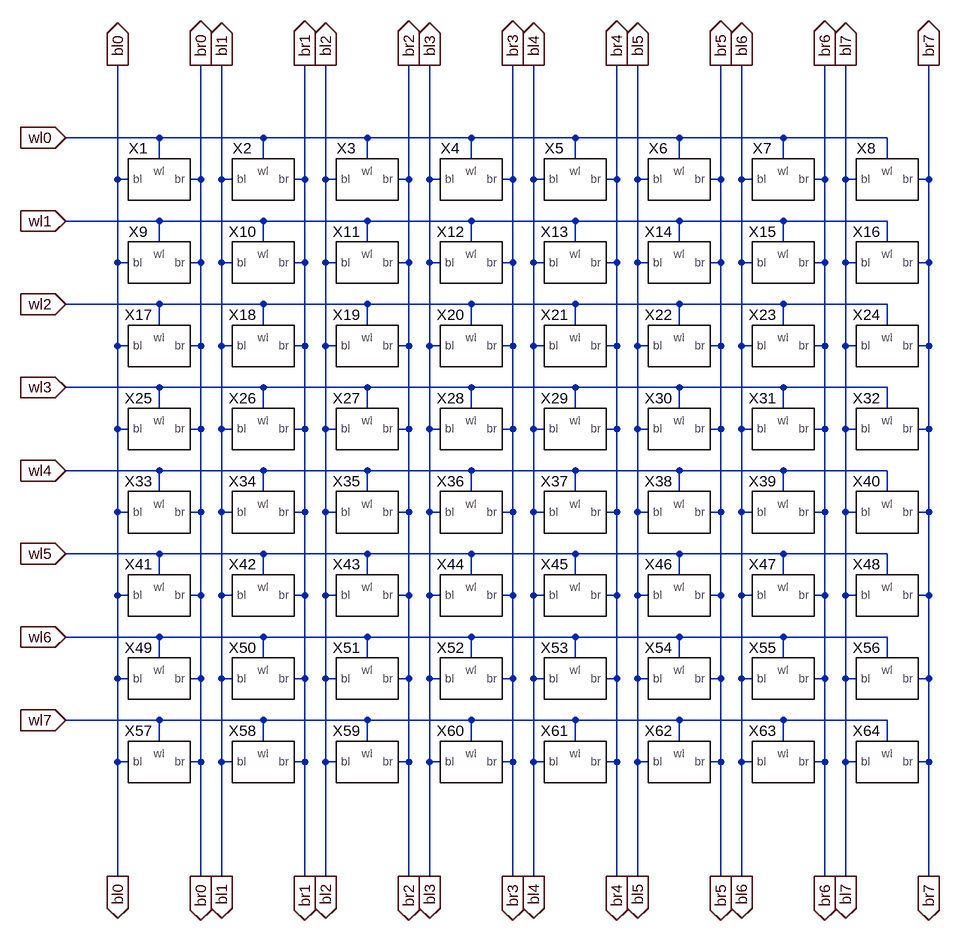
[diagram p0: schematic 8x8_array.asc]
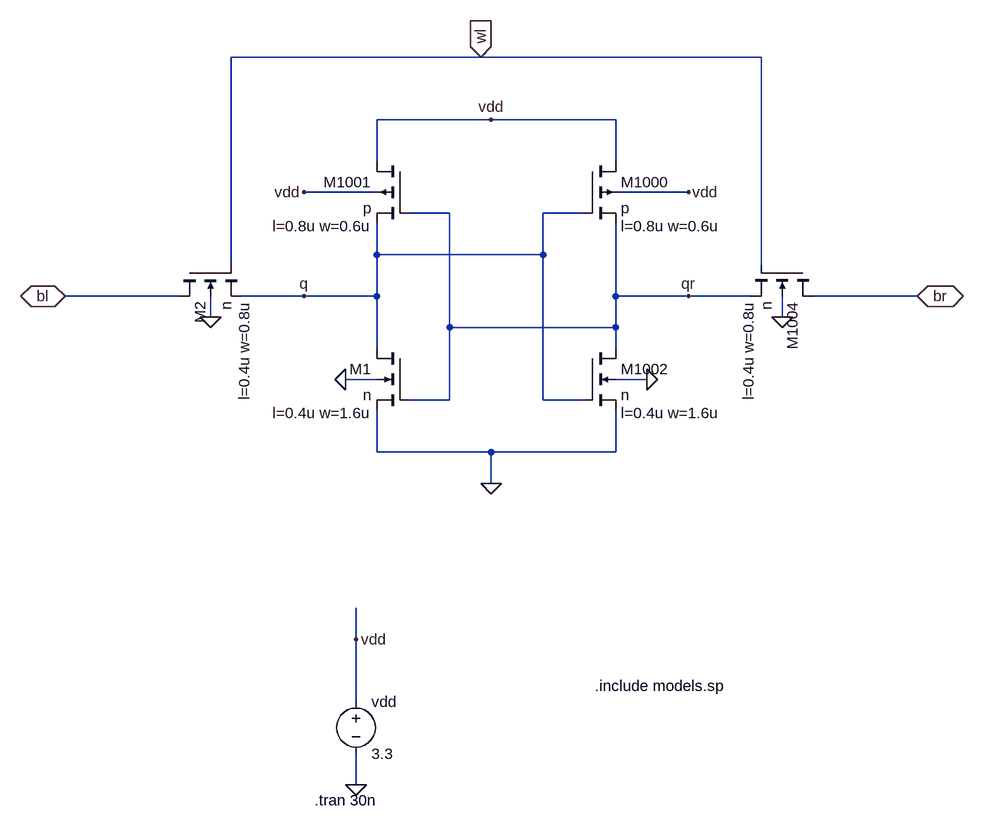
[diagram p1: sub-circuit cell_1rw.asc]
8x8_array.asc, the LTspice schematic file:
Version 4
SHEET 1 1432 1380
WIRE -160 -160 -304 -160
WIRE 0 -160 -160 -160
WIRE 160 -160 0 -160
WIRE 320 -160 160 -160
WIRE 480 -160 320 -160
WIRE 640 -160 480 -160
WIRE 800 -160 640 -160
WIRE 960 -160 800 -160
WIRE -160 -128 -160 -160
WIRE 0 -128 0 -160
WIRE 160 -128 160 -160
WIRE 320 -128 320 -160
WIRE 480 -128 480 -160
WIRE 640 -128 640 -160
WIRE 800 -128 800 -160
WIRE 960 -128 960 -160
WIRE -224 -96 -224 -272
WIRE -208 -96 -224 -96
WIRE -96 -96 -96 -272
WIRE -96 -96 -112 -96
WIRE -64 -96 -64 -272
WIRE -48 -96 -64 -96
WIRE 64 -96 64 -272
WIRE 64 -96 48 -96
WIRE 96 -96 96 -272
WIRE 112 -96 96 -96
WIRE 224 -96 224 -272
WIRE 224 -96 208 -96
WIRE 256 -96 256 -272
WIRE 272 -96 256 -96
WIRE 384 -96 384 -272
WIRE 384 -96 368 -96
WIRE 416 -96 416 -272
WIRE 432 -96 416 -96
WIRE 544 -96 544 -272
WIRE 544 -96 528 -96
WIRE 576 -96 576 -272
WIRE 592 -96 576 -96
WIRE 704 -96 704 -272
WIRE 704 -96 688 -96
WIRE 736 -96 736 -272
WIRE 752 -96 736 -96
WIRE 864 -96 864 -272
WIRE 864 -96 848 -96
WIRE 896 -96 896 -272
WIRE 912 -96 896 -96
WIRE 1024 -96 1024 -272
WIRE 1024 -96 1008 -96
WIRE -160 -32 -304 -32
WIRE 0 -32 -160 -32
WIRE 160 -32 0 -32
WIRE 320 -32 160 -32
WIRE 480 -32 320 -32
WIRE 640 -32 480 -32
WIRE 800 -32 640 -32
WIRE 960 -32 800 -32
WIRE -160 0 -160 -32
WIRE 0 0 0 -32
WIRE 160 0 160 -32
WIRE 320 0 320 -32
WIRE 480 0 480 -32
WIRE 640 0 640 -32
WIRE 800 0 800 -32
WIRE 960 0 960 -32
WIRE -224 32 -224 -96
WIRE -208 32 -224 32
WIRE -96 32 -96 -96
WIRE -96 32 -112 32
WIRE -64 32 -64 -96
WIRE -48 32 -64 32
WIRE 64 32 64 -96
WIRE 64 32 48 32
WIRE 96 32 96 -96
WIRE 112 32 96 32
WIRE 224 32 224 -96
WIRE 224 32 208 32
WIRE 256 32 256 -96
WIRE 272 32 256 32
WIRE 384 32 384 -96
WIRE 384 32 368 32
WIRE 416 32 416 -96
WIRE 432 32 416 32
WIRE 544 32 544 -96
WIRE 544 32 528 32
WIRE 576 32 576 -96
WIRE 592 32 576 32
WIRE 704 32 704 -96
WIRE 704 32 688 32
WIRE 736 32 736 -96
WIRE 752 32 736 32
WIRE 864 32 864 -96
WIRE 864 32 848 32
WIRE 896 32 896 -96
WIRE 912 32 896 32
WIRE 1024 32 1024 -96
WIRE 1024 32 1008 32
WIRE -160 96 -304 96
WIRE 0 96 -160 96
WIRE 160 96 0 96
WIRE 320 96 160 96
WIRE 480 96 320 96
WIRE 640 96 480 96
WIRE 800 96 640 96
WIRE 960 96 800 96
WIRE -160 128 -160 96
WIRE 0 128 0 96
WIRE 160 128 160 96
WIRE 320 128 320 96
WIRE 480 128 480 96
WIRE 640 128 640 96
WIRE 800 128 800 96
WIRE 960 128 960 96
WIRE -224 160 -224 32
WIRE -208 160 -224 160
WIRE -96 160 -96 32
WIRE -96 160 -112 160
WIRE -64 160 -64 32
WIRE -48 160 -64 160
WIRE 64 160 64 32
WIRE 64 160 48 160
WIRE 96 160 96 32
WIRE 112 160 96 160
WIRE 224 160 224 32
WIRE 224 160 208 160
WIRE 256 160 256 32
WIRE 272 160 256 160
WIRE 384 160 384 32
WIRE 384 160 368 160
WIRE 416 160 416 32
WIRE 432 160 416 160
WIRE 544 160 544 32
WIRE 544 160 528 160
WIRE 576 160 576 32
WIRE 592 160 576 160
WIRE 704 160 704 32
WIRE 704 160 688 160
WIRE 736 160 736 32
WIRE 752 160 736 160
WIRE 864 160 864 32
WIRE 864 160 848 160
WIRE 896 160 896 32
WIRE 912 160 896 160
WIRE 1024 160 1024 32
WIRE 1024 160 1008 160
WIRE -160 224 -304 224
WIRE 0 224 -160 224
WIRE 160 224 0 224
WIRE 320 224 160 224
WIRE 480 224 320 224
WIRE 640 224 480 224
WIRE 800 224 640 224
WIRE 960 224 800 224
WIRE -160 256 -160 224
WIRE 0 256 0 224
WIRE 160 256 160 224
WIRE 320 256 320 224
WIRE 480 256 480 224
WIRE 640 256 640 224
WIRE 800 256 800 224
WIRE 960 256 960 224
WIRE -224 288 -224 160
WIRE -208 288 -224 288
WIRE -96 288 -96 160
WIRE -96 288 -112 288
WIRE -64 288 -64 160
WIRE -48 288 -64 288
WIRE 64 288 64 160
WIRE 64 288 48 288
WIRE 96 288 96 160
WIRE 112 288 96 288
WIRE 224 288 224 160
WIRE 224 288 208 288
WIRE 256 288 256 160
WIRE 272 288 256 288
WIRE 384 288 384 160
WIRE 384 288 368 288
WIRE 416 288 416 160
WIRE 432 288 416 288
WIRE 544 288 544 160
WIRE 544 288 528 288
WIRE 576 288 576 160
WIRE 592 288 576 288
WIRE 704 288 704 160
WIRE 704 288 688 288
WIRE 736 288 736 160
WIRE 752 288 736 288
WIRE 864 288 864 160
WIRE 864 288 848 288
WIRE 896 288 896 160
WIRE 912 288 896 288
WIRE 1024 288 1024 160
WIRE 1024 288 1008 288
WIRE -160 352 -304 352
WIRE 0 352 -160 352
WIRE 160 352 0 352
WIRE 320 352 160 352
WIRE 480 352 320 352
WIRE 640 352 480 352
WIRE 800 352 640 352
WIRE 960 352 800 352
WIRE -160 384 -160 352
WIRE 0 384 0 352
WIRE 160 384 160 352
WIRE 320 384 320 352
WIRE 480 384 480 352
WIRE 640 384 640 352
WIRE 800 384 800 352
WIRE 960 384 960 352
WIRE -224 416 -224 288
WIRE -208 416 -224 416
WIRE -96 416 -96 288
WIRE -96 416 -112 416
WIRE -64 416 -64 288
WIRE -48 416 -64 416
WIRE 64 416 64 288
WIRE 64 416 48 416
WIRE 96 416 96 288
WIRE 112 416 96 416
WIRE 224 416 224 288
WIRE 224 416 208 416
WIRE 256 416 256 288
WIRE 272 416 256 416
WIRE 384 416 384 288
WIRE 384 416 368 416
WIRE 416 416 416 288
WIRE 432 416 416 416
WIRE 544 416 544 288
WIRE 544 416 528 416
WIRE 576 416 576 288
WIRE 592 416 576 416
WIRE 704 416 704 288
WIRE 704 416 688 416
WIRE 736 416 736 288
WIRE 752 416 736 416
WIRE 864 416 864 288
WIRE 864 416 848 416
WIRE 896 416 896 288
WIRE 912 416 896 416
WIRE 1024 416 1024 288
WIRE 1024 416 1008 416
WIRE -160 480 -304 480
WIRE 0 480 -160 480
WIRE 160 480 0 480
WIRE 320 480 160 480
WIRE 480 480 320 480
WIRE 640 480 480 480
WIRE 800 480 640 480
WIRE 960 480 800 480
WIRE -160 512 -160 480
WIRE 0 512 0 480
WIRE 160 512 160 480
WIRE 320 512 320 480
WIRE 480 512 480 480
WIRE 640 512 640 480
WIRE 800 512 800 480
WIRE 960 512 960 480
WIRE -224 544 -224 416
WIRE -208 544 -224 544
WIRE -96 544 -96 416
WIRE -96 544 -112 544
WIRE -64 544 -64 416
WIRE -48 544 -64 544
WIRE 64 544 64 416
WIRE 64 544 48 544
WIRE 96 544 96 416
WIRE 112 544 96 544
WIRE 224 544 224 416
WIRE 224 544 208 544
WIRE 256 544 256 416
WIRE 272 544 256 544
WIRE 384 544 384 416
WIRE 384 544 368 544
WIRE 416 544 416 416
WIRE 432 544 416 544
WIRE 544 544 544 416
WIRE 544 544 528 544
WIRE 576 544 576 416
WIRE 592 544 576 544
WIRE 704 544 704 416
WIRE 704 544 688 544
WIRE 736 544 736 416
WIRE 752 544 736 544
WIRE 864 544 864 416
WIRE 864 544 848 544
WIRE 896 544 896 416
WIRE 912 544 896 544
WIRE 1024 544 1024 416
WIRE 1024 544 1008 544
WIRE -160 608 -304 608
WIRE 0 608 -160 608
WIRE 160 608 0 608
WIRE 320 608 160 608
WIRE 480 608 320 608
WIRE 640 608 480 608
WIRE 800 608 640 608
WIRE 960 608 800 608
WIRE -160 640 -160 608
WIRE 0 640 0 608
WIRE 160 640 160 608
WIRE 320 640 320 608
WIRE 480 640 480 608
WIRE 640 640 640 608
WIRE 800 640 800 608
WIRE 960 640 960 608
WIRE -224 672 -224 544
WIRE -208 672 -224 672
WIRE -96 672 -96 544
WIRE -96 672 -112 672
WIRE -64 672 -64 544
WIRE -48 672 -64 672
WIRE 64 672 64 544
WIRE 64 672 48 672
WIRE 96 672 96 544
WIRE 112 672 96 672
WIRE 224 672 224 544
WIRE 224 672 208 672
WIRE 256 672 256 544
WIRE 272 672 256 672
WIRE 384 672 384 544
WIRE 384 672 368 672
WIRE 416 672 416 544
WIRE 432 672 416 672
WIRE 544 672 544 544
WIRE 544 672 528 672
WIRE 576 672 576 544
WIRE 592 672 576 672
WIRE 704 672 704 544
WIRE 704 672 688 672
WIRE 736 672 736 544
WIRE 752 672 736 672
WIRE 864 672 864 544
WIRE 864 672 848 672
WIRE 896 672 896 544
WIRE 912 672 896 672
WIRE 1024 672 1024 544
WIRE 1024 672 1008 672
WIRE -160 736 -304 736
WIRE 0 736 -160 736
WIRE 160 736 0 736
WIRE 320 736 160 736
WIRE 480 736 320 736
WIRE 640 736 480 736
WIRE 800 736 640 736
WIRE 960 736 800 736
WIRE -160 768 -160 736
WIRE 0 768 0 736
WIRE 160 768 160 736
WIRE 320 768 320 736
WIRE 480 768 480 736
WIRE 640 768 640 736
WIRE 800 768 800 736
WIRE 960 768 960 736
WIRE -224 800 -224 672
WIRE -208 800 -224 800
WIRE -96 800 -96 672
WIRE -96 800 -112 800
WIRE -64 800 -64 672
WIRE -48 800 -64 800
WIRE 64 800 64 672
WIRE 64 800 48 800
WIRE 96 800 96 672
WIRE 112 800 96 800
WIRE 224 800 224 672
WIRE 224 800 208 800
WIRE 256 800 256 672
WIRE 272 800 256 800
WIRE 384 800 384 672
WIRE 384 800 368 800
WIRE 416 800 416 672
WIRE 432 800 416 800
WIRE 544 800 544 672
WIRE 544 800 528 800
WIRE 576 800 576 672
WIRE 592 800 576 800
WIRE 704 800 704 672
WIRE 704 800 688 800
WIRE 736 800 736 672
WIRE 752 800 736 800
WIRE 864 800 864 672
WIRE 864 800 848 800
WIRE 896 800 896 672
WIRE 912 800 896 800
WIRE 1024 800 1024 672
WIRE 1024 800 1008 800
WIRE -224 976 -224 800
WIRE -96 976 -96 800
WIRE -64 976 -64 800
WIRE 64 976 64 800
WIRE 96 976 96 800
WIRE 224 976 224 800
WIRE 256 976 256 800
WIRE 384 976 384 800
WIRE 416 976 416 800
WIRE 544 976 544 800
WIRE 576 976 576 800
WIRE 704 976 704 800
WIRE 736 976 736 800
WIRE 864 976 864 800
WIRE 896 976 896 800
WIRE 1024 976 1024 800
FLAG -304 -160 wl0
IOPIN -304 -160 In
FLAG -304 -32 wl1
IOPIN -304 -32 In
FLAG -304 96 wl2
IOPIN -304 96 In
FLAG -304 224 wl3
IOPIN -304 224 In
FLAG -304 352 wl4
IOPIN -304 352 In
FLAG -304 480 wl5
IOPIN -304 480 In
FLAG -304 608 wl6
IOPIN -304 608 In
FLAG -304 736 wl7
IOPIN -304 736 In
FLAG -224 -272 bl0
IOPIN -224 -272 Out
FLAG -96 -272 br0
IOPIN -96 -272 Out
FLAG 736 -272 bl6
IOPIN 736 -272 Out
FLAG 864 -272 br6
IOPIN 864 -272 Out
FLAG 576 -272 bl5
IOPIN 576 -272 Out
FLAG 704 -272 br5
IOPIN 704 -272 Out
FLAG 416 -272 bl4
IOPIN 416 -272 Out
FLAG 544 -272 br4
IOPIN 544 -272 Out
FLAG 256 -272 bl3
IOPIN 256 -272 Out
FLAG 384 -272 br3
IOPIN 384 -272 Out
FLAG 96 -272 bl2
IOPIN 96 -272 Out
FLAG 224 -272 br2
IOPIN 224 -272 Out
FLAG -64 -272 bl1
IOPIN -64 -272 Out
FLAG 64 -272 br1
IOPIN 64 -272 Out
FLAG 896 -272 bl7
IOPIN 896 -272 Out
FLAG 1024 -272 br7
IOPIN 1024 -272 Out
FLAG -224 976 bl0
IOPIN -224 976 Out
FLAG -96 976 br0
IOPIN -96 976 Out
FLAG -64 976 bl1
IOPIN -64 976 Out
FLAG 64 976 br1
IOPIN 64 976 Out
FLAG 96 976 bl2
IOPIN 96 976 Out
FLAG 224 976 br2
IOPIN 224 976 Out
FLAG 256 976 bl3
IOPIN 256 976 Out
FLAG 384 976 br3
IOPIN 384 976 Out
FLAG 416 976 bl4
IOPIN 416 976 Out
FLAG 544 976 br4
IOPIN 544 976 Out
FLAG 576 976 bl5
IOPIN 576 976 Out
FLAG 704 976 br5
IOPIN 704 976 Out
FLAG 736 976 bl6
IOPIN 736 976 Out
FLAG 864 976 br6
IOPIN 864 976 Out
FLAG 896 976 bl7
IOPIN 896 976 Out
FLAG 1024 976 br7
IOPIN 1024 976 Out
SYMBOL cell_1rw -160 -96 R0
SYMATTR InstName X1
SYMBOL cell_1rw 0 -96 R0
SYMATTR InstName X2
SYMBOL cell_1rw 160 -96 R0
SYMATTR InstName X3
SYMBOL cell_1rw 320 -96 R0
SYMATTR InstName X4
SYMBOL cell_1rw 480 -96 R0
SYMATTR InstName X5
SYMBOL cell_1rw 640 -96 R0
SYMATTR InstName X6
SYMBOL cell_1rw 800 -96 R0
SYMATTR InstName X7
SYMBOL cell_1rw 960 -96 R0
SYMATTR InstName X8
SYMBOL cell_1rw -160 32 R0
SYMATTR InstName X9
SYMBOL cell_1rw 0 32 R0
SYMATTR InstName X10
SYMBOL cell_1rw 160 32 R0
SYMATTR InstName X11
SYMBOL cell_1rw 320 32 R0
SYMATTR InstName X12
SYMBOL cell_1rw 480 32 R0
SYMATTR InstName X13
SYMBOL cell_1rw 640 32 R0
SYMATTR InstName X14
SYMBOL cell_1rw 800 32 R0
SYMATTR InstName X15
SYMBOL cell_1rw 960 32 R0
SYMATTR InstName X16
SYMBOL cell_1rw -160 160 R0
SYMATTR InstName X17
SYMBOL cell_1rw 0 160 R0
SYMATTR InstName X18
SYMBOL cell_1rw 160 160 R0
SYMATTR InstName X19
SYMBOL cell_1rw 320 160 R0
SYMATTR InstName X20
SYMBOL cell_1rw 480 160 R0
SYMATTR InstName X21
SYMBOL cell_1rw 640 160 R0
SYMATTR InstName X22
SYMBOL cell_1rw 800 160 R0
SYMATTR InstName X23
SYMBOL cell_1rw 960 160 R0
SYMATTR InstName X24
SYMBOL cell_1rw -160 288 R0
SYMATTR InstName X25
SYMBOL cell_1rw 0 288 R0
SYMATTR InstName X26
SYMBOL cell_1rw 160 288 R0
SYMATTR InstName X27
SYMBOL cell_1rw 320 288 R0
SYMATTR InstName X28
SYMBOL cell_1rw 480 288 R0
SYMATTR InstName X29
SYMBOL cell_1rw 640 288 R0
SYMATTR InstName X30
SYMBOL cell_1rw 800 288 R0
SYMATTR InstName X31
SYMBOL cell_1rw 960 288 R0
SYMATTR InstName X32
SYMBOL cell_1rw -160 416 R0
SYMATTR InstName X33
SYMBOL cell_1rw 0 416 R0
SYMATTR InstName X34
SYMBOL cell_1rw 160 416 R0
SYMATTR InstName X35
SYMBOL cell_1rw 320 416 R0
SYMATTR InstName X36
SYMBOL cell_1rw 480 416 R0
SYMATTR InstName X37
SYMBOL cell_1rw 640 416 R0
SYMATTR InstName X38
SYMBOL cell_1rw 800 416 R0
SYMATTR InstName X39
SYMBOL cell_1rw 960 416 R0
SYMATTR InstName X40
SYMBOL cell_1rw -160 544 R0
SYMATTR InstName X41
SYMBOL cell_1rw 0 544 R0
SYMATTR InstName X42
SYMBOL cell_1rw 160 544 R0
SYMATTR InstName X43
SYMBOL cell_1rw 320 544 R0
SYMATTR InstName X44
SYMBOL cell_1rw 480 544 R0
SYMATTR InstName X45
SYMBOL cell_1rw 640 544 R0
SYMATTR InstName X46
SYMBOL cell_1rw 800 544 R0
SYMATTR InstName X47
SYMBOL cell_1rw 960 544 R0
SYMATTR InstName X48
SYMBOL cell_1rw -160 672 R0
SYMATTR InstName X49
SYMBOL cell_1rw 0 672 R0
SYMATTR InstName X50
SYMBOL cell_1rw 160 672 R0
SYMATTR InstName X51
SYMBOL cell_1rw 320 672 R0
SYMATTR InstName X52
SYMBOL cell_1rw 480 672 R0
SYMATTR InstName X53
SYMBOL cell_1rw 640 672 R0
SYMATTR InstName X54
SYMBOL cell_1rw 800 672 R0
SYMATTR InstName X55
SYMBOL cell_1rw 960 672 R0
SYMATTR InstName X56
SYMBOL cell_1rw -160 800 R0
SYMATTR InstName X57
SYMBOL cell_1rw 0 800 R0
SYMATTR InstName X58
SYMBOL cell_1rw 160 800 R0
SYMATTR InstName X59
SYMBOL cell_1rw 320 800 R0
SYMATTR InstName X60
SYMBOL cell_1rw 480 800 R0
SYMATTR InstName X61
SYMBOL cell_1rw 640 800 R0
SYMATTR InstName X62
SYMBOL cell_1rw 800 800 R0
SYMATTR InstName X63
SYMBOL cell_1rw 960 800 R0
SYMATTR InstName X64

cell_1rw.asc, the sub-circuit schematic file:
Version 4
SHEET 1 916 1080
WIRE 160 -80 -224 -80
WIRE 592 -80 160 -80
WIRE 176 16 0 16
WIRE 368 16 176 16
WIRE 0 80 0 16
WIRE 368 80 368 16
WIRE 0 128 -112 128
WIRE 480 128 368 128
WIRE 112 160 48 160
WIRE 320 160 256 160
WIRE 0 224 0 176
WIRE 256 224 256 160
WIRE 256 224 0 224
WIRE -224 240 -224 -80
WIRE 592 240 592 -80
WIRE -304 288 -480 288
WIRE -112 288 -208 288
WIRE 0 288 0 224
WIRE 0 288 -112 288
WIRE 368 288 368 176
WIRE 480 288 368 288
WIRE 576 288 480 288
WIRE 832 288 672 288
WIRE -256 320 -256 288
WIRE 624 320 624 288
WIRE 112 336 112 160
WIRE 368 336 368 288
WIRE 368 336 112 336
WIRE 0 368 0 288
WIRE 368 368 368 336
WIRE 0 416 -48 416
WIRE 416 416 368 416
WIRE 112 448 112 336
WIRE 112 448 48 448
WIRE 256 448 256 224
WIRE 320 448 256 448
WIRE 0 528 0 464
WIRE 176 528 0 528
WIRE 368 528 368 464
WIRE 368 528 176 528
WIRE 176 576 176 528
WIRE -32 816 -32 768
WIRE -32 912 -32 816
WIRE -32 1040 -32 992
FLAG 176 576 0
FLAG -32 1040 0
FLAG -32 816 vdd
FLAG 176 16 vdd
FLAG 416 416 0
FLAG -48 416 0
FLAG 624 320 0
FLAG -256 320 0
FLAG -112 128 vdd
FLAG 480 128 vdd
FLAG -480 288 bl
IOPIN -480 288 BiDir
FLAG 160 -80 wl
IOPIN 160 -80 In
FLAG 832 288 br
IOPIN 832 288 BiDir
FLAG -112 288 q
FLAG 480 288 qr
SYMBOL pmos4 320 80 R0
WINDOW 123 56 100 Left 2
SYMATTR Value2 l=0.8u w=0.6u
SYMATTR InstName M1000
SYMATTR Value p
SYMBOL pmos4 48 80 M0
WINDOW 123 56 100 Left 2
SYMATTR Value2 l=0.8u w=0.6u
SYMATTR InstName M1001
SYMATTR Value p
SYMBOL nmos4 320 368 R0
WINDOW 123 56 100 Left 2
SYMATTR Value2 l=0.4u w=1.6u
SYMATTR InstName M1002
SYMATTR Value n
SYMBOL nmos4 48 368 M0
WINDOW 123 56 100 Left 2
SYMATTR Value2 l=0.4u w=1.6u
SYMATTR InstName M1
SYMATTR Value n
SYMBOL voltage -32 896 R0
WINDOW 123 0 0 Left 0
WINDOW 39 0 0 Left 0
SYMATTR InstName vdd
SYMATTR Value 3.3
SYMBOL nmos4 672 240 R90
WINDOW 123 56 100 Left 2
SYMATTR Value2 l=0.4u w=0.8u
SYMATTR InstName M1004
SYMATTR Value n
SYMBOL nmos4 -304 240 M90
WINDOW 123 56 100 Left 2
SYMATTR Value2 l=0.4u w=0.8u
SYMATTR InstName M2
SYMATTR Value n
TEXT 336 888 Left 2 !.include models.sp
TEXT -96 1064 Left 2 !.tran 30n

The netlist it stands for:
* 8x8_array.asc
XX1 wl0 bl0 br0 cell_1rw
XX2 wl0 bl1 br1 cell_1rw
XX3 wl0 bl2 br2 cell_1rw
XX4 wl0 bl3 br3 cell_1rw
XX5 wl0 bl4 br4 cell_1rw
XX6 wl0 bl5 br5 cell_1rw
XX7 wl0 bl6 br6 cell_1rw
XX8 wl0 bl7 br7 cell_1rw
XX9 wl1 bl0 br0 cell_1rw
XX10 wl1 bl1 br1 cell_1rw
XX11 wl1 bl2 br2 cell_1rw
XX12 wl1 bl3 br3 cell_1rw
XX13 wl1 bl4 br4 cell_1rw
XX14 wl1 bl5 br5 cell_1rw
XX15 wl1 bl6 br6 cell_1rw
XX16 wl1 bl7 br7 cell_1rw
XX17 wl2 bl0 br0 cell_1rw
XX18 wl2 bl1 br1 cell_1rw
XX19 wl2 bl2 br2 cell_1rw
XX20 wl2 bl3 br3 cell_1rw
XX21 wl2 bl4 br4 cell_1rw
XX22 wl2 bl5 br5 cell_1rw
XX23 wl2 bl6 br6 cell_1rw
XX24 wl2 bl7 br7 cell_1rw
XX25 wl3 bl0 br0 cell_1rw
XX26 wl3 bl1 br1 cell_1rw
XX27 wl3 bl2 br2 cell_1rw
XX28 wl3 bl3 br3 cell_1rw
XX29 wl3 bl4 br4 cell_1rw
XX30 wl3 bl5 br5 cell_1rw
XX31 wl3 bl6 br6 cell_1rw
XX32 wl3 bl7 br7 cell_1rw
XX33 wl4 bl0 br0 cell_1rw
XX34 wl4 bl1 br1 cell_1rw
XX35 wl4 bl2 br2 cell_1rw
XX36 wl4 bl3 br3 cell_1rw
XX37 wl4 bl4 br4 cell_1rw
XX38 wl4 bl5 br5 cell_1rw
XX39 wl4 bl6 br6 cell_1rw
XX40 wl4 bl7 br7 cell_1rw
XX41 wl5 bl0 br0 cell_1rw
XX42 wl5 bl1 br1 cell_1rw
XX43 wl5 bl2 br2 cell_1rw
XX44 wl5 bl3 br3 cell_1rw
XX45 wl5 bl4 br4 cell_1rw
XX46 wl5 bl5 br5 cell_1rw
XX47 wl5 bl6 br6 cell_1rw
XX48 wl5 bl7 br7 cell_1rw
XX49 wl6 bl0 br0 cell_1rw
XX50 wl6 bl1 br1 cell_1rw
XX51 wl6 bl2 br2 cell_1rw
XX52 wl6 bl3 br3 cell_1rw
XX53 wl6 bl4 br4 cell_1rw
XX54 wl6 bl5 br5 cell_1rw
XX55 wl6 bl6 br6 cell_1rw
XX56 wl6 bl7 br7 cell_1rw
XX57 wl7 bl0 br0 cell_1rw
XX58 wl7 bl1 br1 cell_1rw
XX59 wl7 bl2 br2 cell_1rw
XX60 wl7 bl3 br3 cell_1rw
XX61 wl7 bl4 br4 cell_1rw
XX62 wl7 bl5 br5 cell_1rw
XX63 wl7 bl6 br6 cell_1rw
XX64 wl7 bl7 br7 cell_1rw

* block symbol definitions
.subckt cell_1rw wl bl br
M1000 vdd q qr vdd p l=0.8u w=0.6u
M1001 vdd qr q vdd p l=0.8u w=0.6u
M1002 qr q 0 0 n l=0.4u w=1.6u
M1 q qr 0 0 n l=0.4u w=1.6u
vdd vdd 0 3.3
M1004 br wl qr 0 n l=0.4u w=0.8u
M2 bl wl q 0 n l=0.4u w=0.8u
.include models.sp
.tran 30n
.ends cell_1rw

.model NMOS NMOS
.model PMOS PMOS
.lib standard.mos
.backanno
.end